# Altium schematic sheet Main.schdoc
size 420 x 297 mm; Symbol: Drawing-Symbol_A4; @Project Name: PCB_Stylophone; @Page Count: 1; @Update Date: 2026-10-23; @Create Date: 2026-10-23; @Schematic Name: Schematic1; @Page No: 1; @Page Name: P1; Company: EasyEDA.com; Version: V1.0; Page Size: A4; Device: Drawing-Symbol_A4; @Create Time: 18:30:40; @Update Time: 18:30:40; Border: 1; Width: 1655; Height: 1170; Region Start: 1; X Region Count: 6; Y Region Count: 4; Blade Width: 10; Title Block Position: 3; @Board Name: Board1
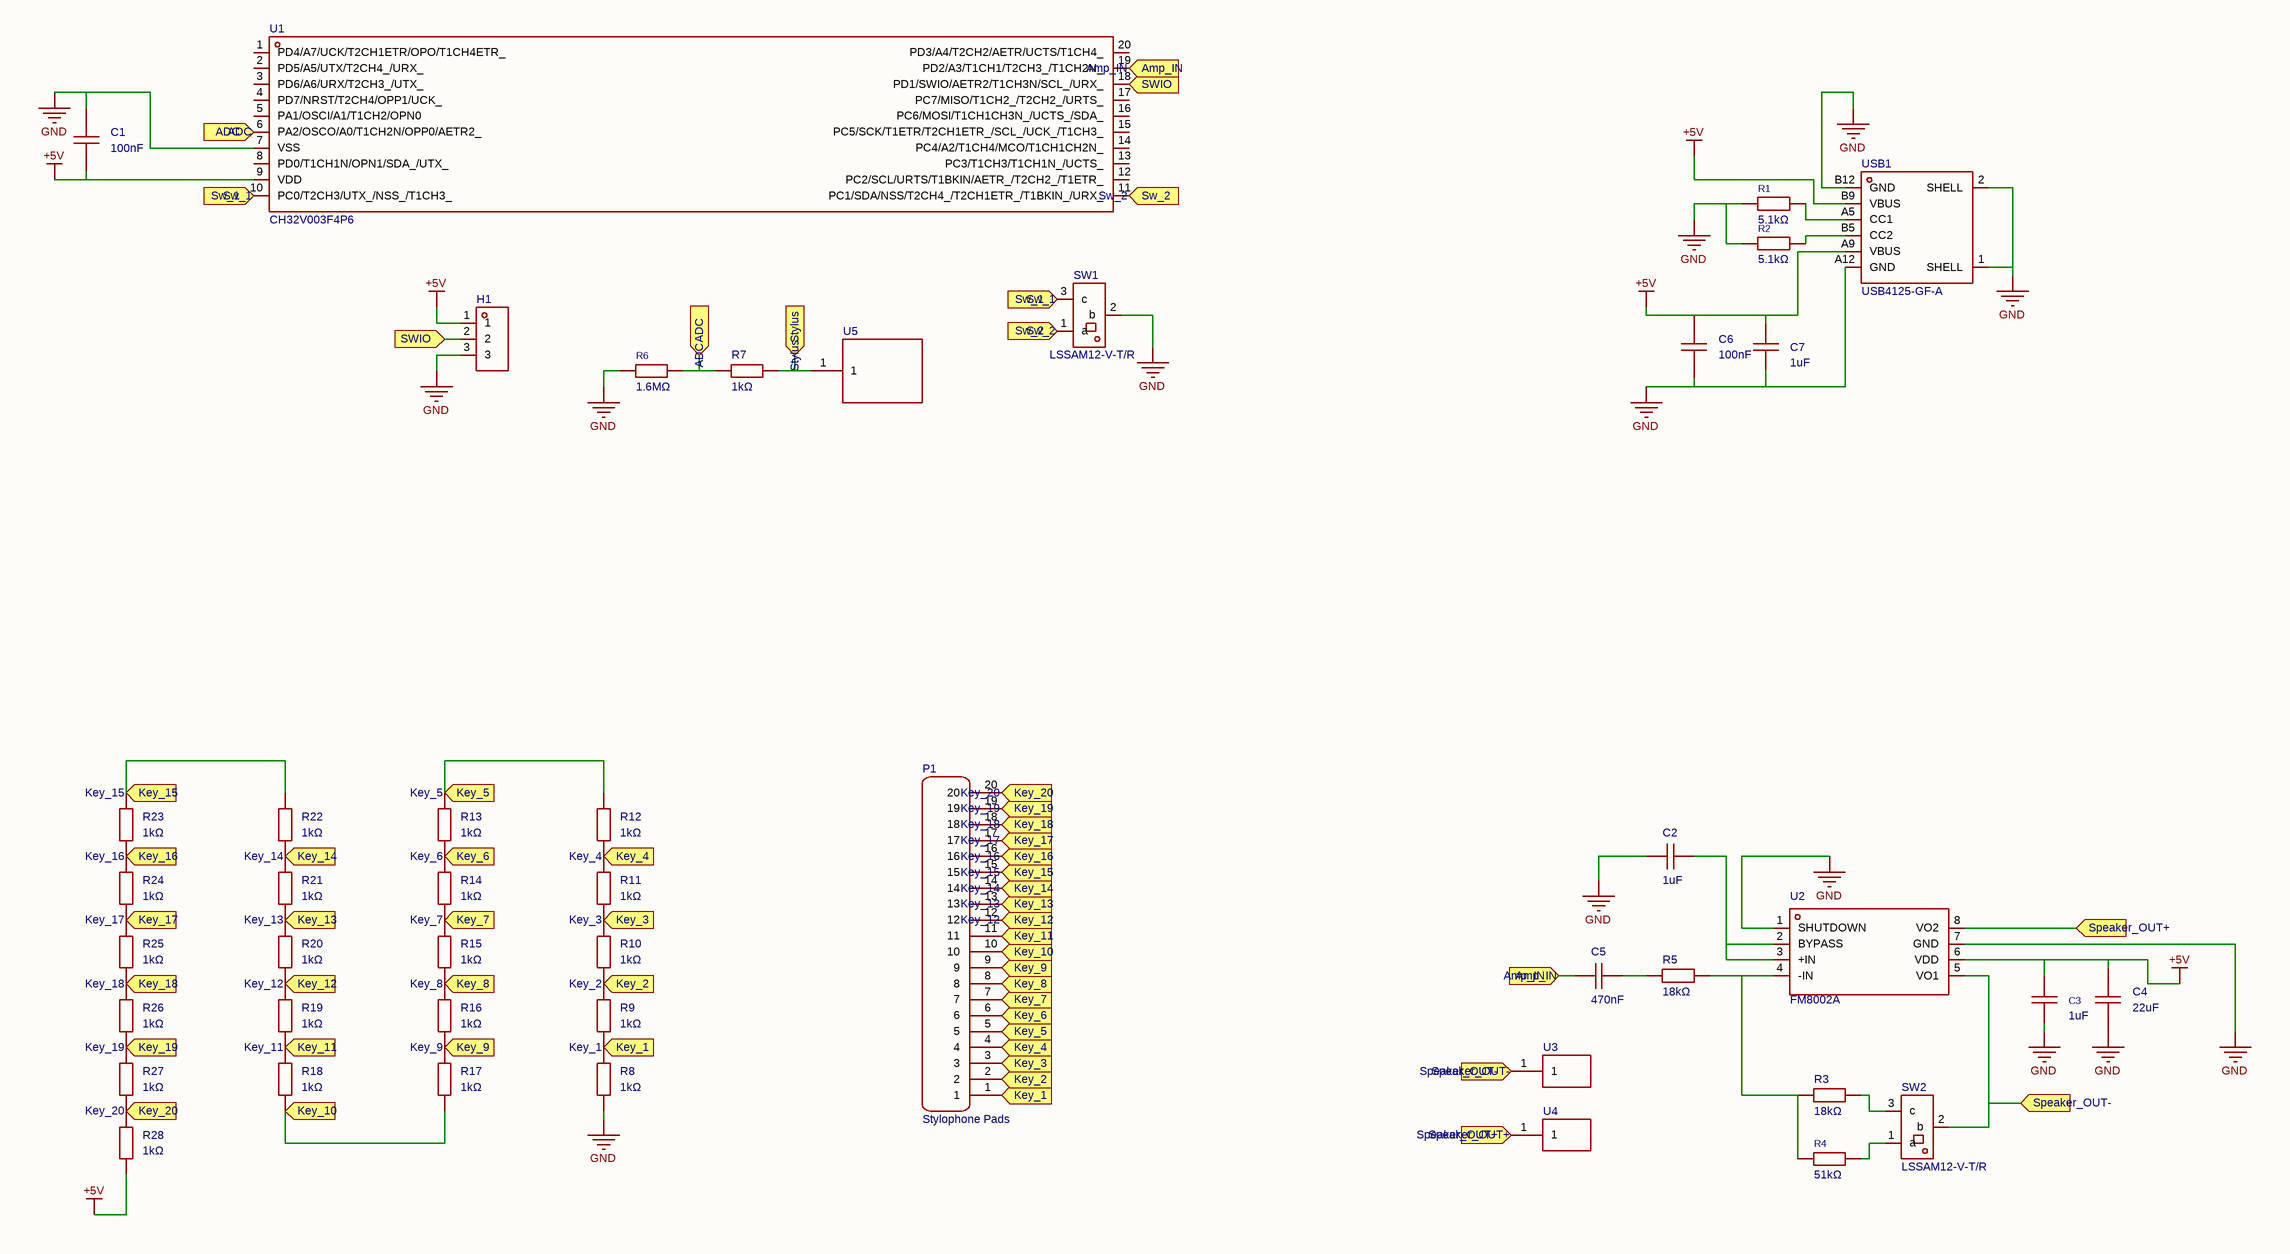
[diagram p0: Main.schdoc]

## Parts
C1  100nF  [C0402]
C2  1uF  [C0402]
C3  1uF  [C0805]
C4  22uF  [C0805]
C5  470nF  [C0402]
C6  100nF  [C0402]
C7  1uF  [C0402]
H1  (no value)  [Top side pads]
P1  Stylophone Pads  [Stylophone_Pads_Footprint]
R1  5.1kΩ  [R0402]
R2  5.1kΩ  [R0402]
R3  18kΩ  [R0402]
R4  51kΩ  [R0402]
R5  18kΩ  [R0402]
R6  1.6MΩ  [R0402]
R7  1kΩ  [R0402]
R8  1kΩ  [R0402]
R9  1kΩ  [R0402]
R10  1kΩ  [R0402]
R11  1kΩ  [R0402]
R12  1kΩ  [R0402]
R13  1kΩ  [R0402]
R14  1kΩ  [R0402]
R15  1kΩ  [R0402]
R16  1kΩ  [R0402]
R17  1kΩ  [R0402]
R18  1kΩ  [R0402]
R19  1kΩ  [R0402]
R20  1kΩ  [R0402]
R21  1kΩ  [R0402]
R22  1kΩ  [R0402]
R23  1kΩ  [R0402]
R24  1kΩ  [R0402]
R25  1kΩ  [R0402]
R26  1kΩ  [R0402]
R27  1kΩ  [R0402]
R28  1kΩ  [R0402]
SW1  LSSAM12-V-T/R  [SW-SMD_LSSAM12-V-T-R]
SW2  LSSAM12-V-T/R  [SW-SMD_LSSAM12-V-T-R]
U1  CH32V003F4P6  [TSSOP-20_L6.5-W4.4-P0.65-LS6.4-BL]
U2  FM8002A  [SOP-8_L4.9-W3.9-P1.27-LS6.0-BL]
U3  (no value)  [Pad2mmx4mm]
U4  (no value)  [Pad2mmx4mm]
U5  (no value)  [Big_Pad_5x5mm]
USB1  USB4125-GF-A  [USB-C-SMD_TYPE-C-6P]

## Ports
ADC (in), Amp_IN (in), Key_1 (in), Key_2 (in), Key_3 (in), Key_4 (in), Key_5 (in), Key_6 (in), Key_7 (in), Key_8 (in), Key_9 (in), Key_10 (in), Key_11 (in), Key_12 (in), Key_13 (in), Key_14 (in), Key_15 (in), Key_16 (in), Key_17 (in), Key_18 (in), Key_19 (in), Key_20 (in), Speaker_OUT+ (in), Speaker_OUT- (in), Stylus (in), Sw_1 (in), Sw_2 (in), SWIO (in)

## Nets
+5V: C1.2 C3.2 C4.2 C6.2 C7.2 H1.1 R28.1 U1.9(VDD) U2.6(VDD) USB1.A9(VBUS) USB1.B9(VBUS)
GND: C1.1 C2.1 C3.1 C4.1 C6.1 C7.1 H1.3 R1.1 R2.1 R6.1 R8.1 SW1.2(b) U1.7(VSS) U2.1(SHUTDOWN) U2.7(GND) USB1.1(SHELL) USB1.2(SHELL) USB1.A12(GND) USB1.B12(GND)
ADC: R6.2 R7.1 U1.6(PA2/OSCO/A0/T1CH2N/OPP0/AETR2_) ; port ADC
Amp_IN: C5.1 U1.19(PD2/A3/T1CH1/T2CH3_/T1CH2N_) ; port Amp_IN
Key_1: P1.1 R8.2 R9.1 ; port Key_1
Key_2: P1.2 R9.2 R10.2 ; port Key_2
Key_3: P1.3 R10.1 R11.2 ; port Key_3
Key_4: P1.4 R11.1 R12.2 ; port Key_4
Key_5: P1.5 R12.1 R13.2 ; port Key_5
Key_6: P1.6 R13.1 R14.2 ; port Key_6
Key_7: P1.7 R14.1 R15.2 ; port Key_7
Key_8: P1.8 R15.1 R16.2 ; port Key_8
Key_9: P1.9 R16.1 R17.2 ; port Key_9
Key_10: P1.10 R17.1 R18.2 ; port Key_10
Key_11: P1.11 R18.1 R19.2 ; port Key_11
Key_12: P1.12 R19.1 R20.2 ; port Key_12
Key_13: P1.13 R20.1 R21.2 ; port Key_13
Key_14: P1.14 R21.1 R22.2 ; port Key_14
Key_15: P1.15 R22.1 R23.2 ; port Key_15
Key_16: P1.16 R23.1 R24.2 ; port Key_16
Key_17: P1.17 R24.1 R25.2 ; port Key_17
Key_18: P1.18 R25.1 R26.2 ; port Key_18
Key_19: P1.19 R26.1 R27.2 ; port Key_19
Key_20: P1.20 R27.1 R28.2 ; port Key_20
Speaker_OUT+: U2.8(VO2) U4.1 ; port Speaker_OUT+
Speaker_OUT-: SW2.2(b) U2.5(VO1) U3.1 ; port Speaker_OUT-
Stylus: R7.2 U5.1 ; port Stylus
Sw_1: SW1.3(c) U1.10(PC0/T2CH3/UTX_/NSS_/T1CH3_) ; port Sw_1
Sw_2: SW1.1(a) U1.11(PC1/SDA/NSS/T2CH4_/T2CH1ETR_/T1BKIN_/URX_) ; port Sw_2
SWIO: H1.2 U1.18(PD1/SWIO/AETR2/T1CH3N/SCL_/URX_) ; port SWIO
NetC2_2: C2.2 U2.2(BYPASS) U2.3(+IN)
NetC5_2: C5.2 R5.1
NetR1_2: R1.2 USB1.A5(CC1)
NetR2_2: R2.2 USB1.B5(CC2)
NetR3_1: R3.1 R4.1 R5.2 U2.4(-IN)
NetR3_2: R3.2 SW2.3(c)
NetR4_2: R4.2 SW2.1(a)

Not connected (* = marked no-connect by the designer): U1 1(PD4/A7/UCK/T2CH1ETR/OPO/T1CH4ETR_) 2(PD5/A5/UTX/T2CH4_/URX_) 3(PD6/A6/URX/T2CH3_/UTX_) 4(PD7/NRST/T2CH4/OPP1/UCK_) 5(PA1/OSCI/A1/T1CH2/OPN0) 8(PD0/T1CH1N/OPN1/SDA_/UTX_) 12(PC2/SCL/URTS/T1BKIN/AETR_/T2CH2_/T1ETR_) 13(PC3/T1CH3/T1CH1N_/UCTS_) 14(PC4/A2/T1CH4/MCO/T1CH1CH2N_) 15(PC5/SCK/T1ETR/T2CH1ETR_/SCL_/UCK_/T1CH3_) 16(PC6/MOSI/T1CH1CH3N_/UCTS_/SDA_) 17(PC7/MISO/T1CH2_/T2CH2_/URTS_) 20(PD3/A4/T2CH2/AETR/UCTS/T1CH4_)

## Notes on the sheet
- Create at
- 2026-10-23
- Schematic
- Board
- Schematic1
- Board1
- Update at
- Page
- P1
- Drawn
- Reviewed
- PCB_Stylophone
- Version
- V1.0
- Size
- A4
- Page  1  Total  1
- EasyEDA.com

## Library data of the parts
C1 C6 = CL05B104KB54PNC: Capacitance:100nF Tolerance:±10% Tolerance:±10% Voltage Rating:50V Temperature Coefficient:X7R; Manufacturer: SAMSUNG(三星); AddInBom: yes; ModelId: b7d13df3e9464d7a99d0651d1a5b4d570819f05c4eef4c71ace90d822a990e87; ModelName: C0402_L1.0-W0.5-H0.5; ModelTransform: 39.37,19.685,0,0,0,0,0,0,0; Tolerance: ±10%; Voltage Rating: 50V; Temperature Coefficient: X7R; Symbol: CL05B104KB54PNC; Device: CL05B104KB54PNC; LCSC Part Name: 100nF ±10% 50V; SupplierPart: C307331; ManufacturerPart: CL05B104KB54PNC; Supplier Footprint: 0402; JLCPCB Part Class: Basic Part; Datasheet: https://item.szlcsc.com/datasheet/CL05B104KB54PNC/291005.html; Supplier: LCSC; ConvertToPcb: yes; FootprintName: C0402; Value: 100nF
C2 C7 = CL05A105KP5NNNC: Capacitance:1uF Tolerance:±10% Tolerance:±10% Voltage Rating:10V Temperature Coefficient:X5R; Manufacturer: SAMSUNG(三星); AddInBom: yes; ModelId: b7d13df3e9464d7a99d0651d1a5b4d570819f05c4eef4c71ace90d822a990e87; ModelName: C0402_L1.0-W0.5-H0.5; ModelTransform: 39.37,19.685,0,0,0,0,0,0,0; Tolerance: ±10%; Voltage Rating: 10V; Temperature Coefficient: X5R; Symbol: CL05A105KP5NNNC; Device: CL05A105KP5NNNC; LCSC Part Name: 1uF ±10% 10V; SupplierPart: C14445; ManufacturerPart: CL05A105KP5NNNC; Supplier Footprint: 0402; JLCPCB Part Class: Extended Part; Datasheet: https://item.szlcsc.com/datasheet/CL05A105KP5NNNC/15107.html; Supplier: LCSC; ConvertToPcb: yes; FootprintName: C0402; Value: 1uF
C3 = CL21B105KBFNNNE: Capacitance:1uF Tolerance:±10% Tolerance:±10% Voltage Rating:50V Temperature Coefficient:X7R; Manufacturer: SAMSUNG(三星); AddInBom: yes; ModelId: 8c88e81f49c6409b980720ec8953afb60819f05c4eef4c71ace90d822a990e87; ModelName: C0805_L2.0-W1.3-H1.3; ModelTransform: 78.74,51.181,0,0,0,0,0,0.0005,0; Tolerance: ±10%; Voltage Rating: 50V; Temperature Coefficient: X7R; Symbol: CL21B105KBFNNNE; Device: CL21B105KBFNNNE; Supplier: LCSC; Manufacturer Part: CL21B105KBFNNNE; Value: 1uF; Supplier Part: C28323; JLCPCB Part Class: Basic Part; LCSC Part Name: 1uF ±10% 50V; Supplier Footprint: 0805; Datasheet: https://item.szlcsc.com/datasheet/CL21B105KBFNNNE/29074.html; ConvertToPcb: yes; FootprintName: C0805
C4 = CL21A226MAQNNNE: Capacitance:22uF Tolerance:±20% Tolerance:±20% Voltage Rating:25V Temperature Coefficient:X5R; Manufacturer: SAMSUNG(三星); AddInBom: yes; ModelId: 8c88e81f49c6409b980720ec8953afb60819f05c4eef4c71ace90d822a990e87; ModelName: C0805_L2.0-W1.3-H1.3; ModelTransform: 78.74,51.181,0,0,0,0,0,0.0005,0; Tolerance: ±20%; Voltage Rating: 25V; Temperature Coefficient: X5R; Symbol: CL21A226MAQNNNE; Device: CL21A226MAQNNNE; LCSC Part Name: 22uF ±20% 25V; SupplierPart: C45783; ManufacturerPart: CL21A226MAQNNNE; Supplier Footprint: 0805; JLCPCB Part Class: Basic Part; Datasheet: https://item.szlcsc.com/datasheet/CL21A226MAQNNNE/46786.html; Supplier: LCSC; ConvertToPcb: yes; FootprintName: C0805; Value: 22uF
C5 = CL05A474KP5NNNC: Capacitance:470nF Tolerance:±10% Tolerance:±10% Voltage Rating:10V Temperature Coefficient:X5R; Manufacturer: SAMSUNG(三星); AddInBom: yes; ModelId: b7d13df3e9464d7a99d0651d1a5b4d570819f05c4eef4c71ace90d822a990e87; ModelName: C0402_L1.0-W0.5-H0.5; ModelTransform: 39.37,19.685,0,0,0,0,0,0,0; Tolerance: ±10%; Voltage Rating: 10V; Temperature Coefficient: X5R; Symbol: CL05A474KP5NNNC; Device: CL05A474KP5NNNC; LCSC Part Name: 470nF ±10% 10V; SupplierPart: C47339; ManufacturerPart: CL05A474KP5NNNC; Supplier Footprint: 0402; JLCPCB Part Class: Extended Part; Datasheet: https://item.szlcsc.com/datasheet/CL05A474KP5NNNC/48344.html; Supplier: LCSC; ConvertToPcb: yes; FootprintName: C0402; Value: 470nF
H1 = HDR-M_2.54_1x3P: Symbol: PZ254V-11-03P_C2937625; ConvertToPcb: yes; ModelId: b83490ae987a4919a987f9b45fc060bc0819f05c4eef4c71ace90d822a990e87; ModelName: HDR-TH_3P-P2.54-M-LI-1X3P; ModelTransform: 300.03877,100,0,0,0,0,0,0,-118.11; Device: HDR-M_2.54_1x3P; AddInBom: yes; Supplier Footprint: Through; FootprintName: Top side pads
P1 = Stylophone_Pads: AddInBom: yes; Symbol: Stylophone_Pads; Device: Stylophone_Pads; ConvertToPcb: yes
R1 R2 = 0402WGF5101TCE: Type:Thick Film Resistor Resistance:5.1kΩ Tolerance:±1% Tolerance:±1% Power(Watts):62.5mW Voltage-Supply(Max):50V Temperature Coefficient:±100ppm/℃ Temperature Coefficient:±100ppm/℃ Operating Temperature:-55℃~+155℃ Operating Temperature:-55℃~+155℃; Manufacturer: UNI-ROYAL(厚声); AddInBom: yes; ModelId: efdecb7dae4442949d28eecaf748420f0819f05c4eef4c71ace90d822a990e87; ModelName: R0402_L1.0-W0.5-H0.4; ModelTransform: 39.37,19.685,0,0,0,0,0,0,0; Tolerance: ±1%; Power(Watts): 62.5mW; Voltage-Supply(Max): 50V; Symbol: 0402WGF5101TCE; Device: 0402WGF5101TCE; Supplier: LCSC; Manufacturer Part: 0402WGF5101TCE; Supplier Part: C25905; Value: 5.1kΩ; JLCPCB Part Class: Basic Part; LCSC Part Name: 厚膜电阻 5.1kΩ ±1%; Supplier Footprint: 0402; Datasheet: https://item.szlcsc.com/datasheet/0402WGF5101TCE/26648.html; ConvertToPcb: yes; FootprintName: R0402; Type: Thick Film Resistor; Temperature Coefficient: ±100ppm/℃; Operating Temperature: -55℃~+155℃
R3 R5 = 0402WGF1802TCE: Type:Thick Film Resistors Resistance:18kΩ Tolerance:±1% Tolerance:±1% Power(Watts):1/16W Voltage-Supply(Max):50V Temperature Coefficient:±100ppm/℃ Temperature Coefficient:±100ppm/℃ Operating Temperature:-55℃~+155℃ Operating Temperature:-55℃~+155℃; Manufacturer: UNI-ROYAL(厚声); AddInBom: yes; ModelId: efdecb7dae4442949d28eecaf748420f0819f05c4eef4c71ace90d822a990e87; ModelName: R0402_L1.0-W0.5-H0.4; ModelTransform: 39.37,19.685,0,0,0,0,0,0,0; Tolerance: ±1%; Power(Watts): 1/16W; Voltage-Supply(Max): 50V; Symbol: 0402WGF1802TCE; Device: 0402WGF1802TCE; LCSC Part Name: 18kΩ ±1% 62.5mW 厚膜电阻; SupplierPart: C25762; ManufacturerPart: 0402WGF1802TCE; Supplier Footprint: 0402; JLCPCB Part Class: Extended Part; Datasheet: https://item.szlcsc.com/datasheet/0402WGF1802TCE/26505.html; Supplier: LCSC; ConvertToPcb: yes; FootprintName: R0402; Type: Thick Film Resistors; Value: 18kΩ; Temperature Coefficient: ±100ppm/℃; Operating Temperature: -55℃~+155℃
R4 = 0402WGF5102TCE: Type:Thick Film Resistors Resistance:51kΩ Tolerance:±1% Tolerance:±1% Power(Watts): Overload Voltage (Max): Temperature Coefficient:±100ppm/℃ Temperature Coefficient:±100ppm/℃ Operating Temperature Range:-55℃~+155℃ Operating Temperature Range:-55℃~+155℃; Manufacturer: UNI-ROYAL(厚声); AddInBom: yes; ModelId: efdecb7dae4442949d28eecaf748420f0819f05c4eef4c71ace90d822a990e87; ModelName: R0402_L1.0-W0.5-H0.4; ModelTransform: 39.37,19.685,0,0,0,0,0,0,0; Tolerance: ±1%; Symbol: 0402WGF5102TCE; Device: 0402WGF5102TCE; Supplier: LCSC; Manufacturer Part: 0402WGF5102TCE; Supplier Part: C25794; Value: 51kΩ; JLCPCB Part Class: Basic Part; LCSC Part Name: 51kΩ ±1% 62.5mW 厚膜电阻; Supplier Footprint: 0402; Datasheet: https://atta.szlcsc.com/upload/public/pdf/source/20200306/C422600_1E6D84923E4A46A82E41ADD87F860B5C.pdf; ConvertToPcb: yes; FootprintName: R0402; Type: Thick Film Resistors; Temperature Coefficient: ±100ppm/℃; Operating Temperature Range: -55℃~+155℃
R6 = 0402WGJ0165TCE: Type:Thick Film Resistor Resistance:1.6MΩ Tolerance:±5% Tolerance:±5% Power(Watts):62.5mW Voltage-Supply(Max):50V Temperature Coefficient:±100ppm/℃ Temperature Coefficient:±100ppm/℃ Operating Temperature:-55℃~+155℃ Operating Temperature:-55℃~+155℃; Manufacturer: UNI-ROYAL(厚声); AddInBom: yes; ModelId: efdecb7dae4442949d28eecaf748420f0819f05c4eef4c71ace90d822a990e87; ModelName: R0402_L1.0-W0.5-H0.4; ModelTransform: 39.37,19.685,0,0,0,0,0,0,0; Tolerance: ±5%; Power(Watts): 62.5mW; Voltage-Supply(Max): 50V; Symbol: 0402WGJ0165TCE; Device: 0402WGJ0165TCE; Supplier: LCSC; Manufacturer Part: 0402WGJ0165TCE; Supplier Part: C57065; Value: 1.6MΩ; JLCPCB Part Class: Extended Part; LCSC Part Name: 1.6MΩ ±5% 62.5mW 厚膜电阻; Supplier Footprint: 0402; Datasheet: https://item.szlcsc.com/datasheet/0402WGJ0165TCE/58095.html; ConvertToPcb: yes; FootprintName: R0402; Type: Thick Film Resistor; Temperature Coefficient: ±100ppm/℃; Operating Temperature: -55℃~+155℃
R7-R28 = 0402WGF1001TCE: Type:Thick Film Resistor Resistance:1kΩ Tolerance:±1% Tolerance:±1% Power(Watts):62.5mW Voltage-Supply(Max):50V Temperature Coefficient:±100ppm/℃ Temperature Coefficient:±100ppm/℃ Operating Temperature:-55℃~+155℃ Operating Temperature:-55℃~+155℃; Manufacturer: UNI-ROYAL(厚声); AddInBom: yes; ModelId: efdecb7dae4442949d28eecaf748420f0819f05c4eef4c71ace90d822a990e87; ModelName: R0402_L1.0-W0.5-H0.4; ModelTransform: 39.37,19.685,0,0,0,0,0,0,0; Tolerance: ±1%; Power(Watts): 62.5mW; Voltage-Supply(Max): 50V; Symbol: 0402WGF1001TCE; Device: 0402WGF1001TCE; LCSC Part Name: 厚膜电阻 1kΩ ±1%; SupplierPart: C11702; ManufacturerPart: 0402WGF1001TCE; Supplier Footprint: 0402; JLCPCB Part Class: Basic Part; Datasheet: https://item.szlcsc.com/datasheet/0402WGF1001TCE/12256.html; Supplier: LCSC; ConvertToPcb: yes; FootprintName: R0402; Type: Thick Film Resistor; Value: 1kΩ; Temperature Coefficient: ±100ppm/℃; Operating Temperature: -55℃~+155℃
SW1 SW2 = LSSAM12-V-T/R: Manufacturer: Diptronics(圜达); AddInBom: yes; ModelId: 89d32238bcfc46f980b69073b5d5a45c0819f05c4eef4c71ace90d822a990e87; ModelTransform: 374.015,295.275,0,0,0,0,0,0,0; Symbol: LSSAM12-V-T/R; Device: LSSAM12-V-T/R; LCSC Part Name: 正拨贴片; SupplierPart: C495944; ManufacturerPart: LSSAM12-V-T/R; Supplier Footprint: SMD,3.5x9.5mm; JLCPCB Part Class: Extended Part; Datasheet: https://atta.szlcsc.com/upload/public/pdf/source/20210205/C495944_F2F3E9E2BCEB1BF3E71EC8DE5A3558B7.pdf; Supplier: LCSC; ConvertToPcb: yes; FootprintName: SW-SMD_LSSAM12-V-T-R; ModelName: SW-SMD_LSSAM12-V-T-R
U1 = CH32V003F4P6: CPU Core:RISC-V2A CPU Maximum Speed:48MHz Core Size:32 Bit Program Storage Size:16KB Program Memory Type:FLASH RAM Size:2KB EEPROM:- Number of I/O:18 ADC (Bit):10bit DAC (Bit):- Oscillator Type:Built-in+External Voltage - Supply:3.3V；5V Voltage - Supply:3; Manufacturer: WCH(南京沁恒); AddInBom: yes; ModelId: d00c537554e8428abe371c2c4fe2166f0819f05c4eef4c71ace90d822a990e87; ModelName: TSSOP-20_L6.5-W4.4-H1.0-LS6.4-P0.65; ModelTransform: 251.969,255.906,0,90,0,0,0.0005,0,0; CPU Maximum Speed: 48MHz; Core Size: 32 Bit; Program Storage Size: 16KB; Program Memory Type: FLASH; RAM Size: 2KB; Number of I/O: 18; ADC (Bit): 10bit; Symbol: CH32V003F4P6; Device: CH32V003F4P6; LCSC Part Name: QingKe V2微处理器; SupplierPart: C5187096; ManufacturerPart: CH32V003F4P6; Supplier Footprint: TSSOP-20-175mil; JLCPCB Part Class: Extended Part; Datasheet: https://item.szlcsc.com/datasheet/CH32V003F4P6/5858783.html; Supplier: LCSC; ConvertToPcb: yes; FootprintName: TSSOP-20_L6.5-W4.4-P0.65-LS6.4-BL; CPU Core: RISC-V2A; EEPROM: -; DAC (Bit): -; Oscillator Type: Built-in+External; Voltage - Supply: 3.3V；5V; Operating Temperature: -40℃~+85℃; Features: -
U2 = FM8002A: Class:- Speaker Channels:1-Channel Output Power:2Wx1@4Ω Total Harmonic Distortion + Noise (THD+N):0.2% Quiescent Current:4.4mA Signal-to-Noise Ratio:- Power Supply Rejection Ratio (PSRR):63dB Efficiency:- Number of Inputs:- Features:Analog voltage gain；En; Manufacturer: FM(富满); AddInBom: yes; ModelId: 9e479aa4755a4392b89c401224ad12750819f05c4eef4c71ace90d822a990e87; ModelName: SOP-8_L4.9-W3.9-P1.27-LS6.0-BL-1; ModelTransform: 192.913,236.22,0,0,0,0,-0.393,2.749,0; Total Harmonic Distortion + Noise (THD+N): 0.2%; Quiescent Current: 4.4mA; Power Supply Rejection Ratio (PSRR): 63dB; Voltage - Supply: 2.5V~5.5V; Symbol: FM8002A; Device: FM8002A; LCSC Part Name: 2W音频功放IC; SupplierPart: C94625; ManufacturerPart: FM8002A; Supplier Footprint: SOP-8; JLCPCB Part Class: Extended Part; Datasheet: https://item.szlcsc.com/datasheet/FM8002A/95823.html; Supplier: LCSC; ConvertToPcb: yes; FootprintName: SOP-8_L4.9-W3.9-P1.27-LS6.0-BL; Class: -; Speaker Channels: 1-Channel; Output Power: 2Wx1@4Ω; Signal-to-Noise Ratio: -; Efficiency: -; Number of Inputs: -; Features: Analog voltage gain；Enable/shutdown function；Automatic mute/no-noise switch; Operating Temperature: -40℃~+85℃
U3 U4 = Pad 2mmx4mm: AddInBom: yes; Symbol: Pad 2mmx4mm; Device: Pad 2mmx4mm; ConvertToPcb: yes; FootprintName: Pad2mmx4mm
U5 = Big_Pad_5x5mm: AddInBom: yes; Symbol: Big_Pad_5x5mm; Device: Big_Pad_5x5mm; ConvertToPcb: yes
USB1 = USB4125-GF-A: Connector Type:Type-C Protocol Standard:- Gender:Female Mounting Type:Surface Mount, Right Angle Number of Contacts:6P Number of Ports:1 Current Rating-Power:3A Voltage Rating:48V Connect-Disconnect Life:- Supplementary Features:- Center Height:- Length:-; Manufacturer: GCT; AddInBom: yes; ModelId: cfacd1732c8a4e589fe9a59bd23df1620819f05c4eef4c71ace90d822a990e87; ModelTransform: 351.9678,267.716,0,0,0,0,0,-43.189,-39.37; Connector Type: Type-C; Gender: Female; Number of Contacts: 6P; Number of Ports: 1; Current Rating-Power: 3A; Voltage Rating: 48V; Detection color: Black; Symbol: USB4125-GF-A; Device: USB4125-GF-A; LCSC Part Name: Type-C 母 卧贴; SupplierPart: C3151650; ManufacturerPart: USB4125-GF-A; Supplier Footprint: SMD; JLCPCB Part Class: Extended Part; Datasheet: https://item.szlcsc.com/datasheet/USB4125-GF-A/3712352.html; Supplier: LCSC; ConvertToPcb: yes; FootprintName: USB-C-SMD_TYPE-C-6P; ModelName: USB-C-SMD_TYPE-C-6P; Protocol Standard: -; Mounting Type: Surface Mount, Right Angle; Connect-Disconnect Life: -; Supplementary Features: -; Center Height: -; Length: -; Operating Temperature: -30℃~+85℃